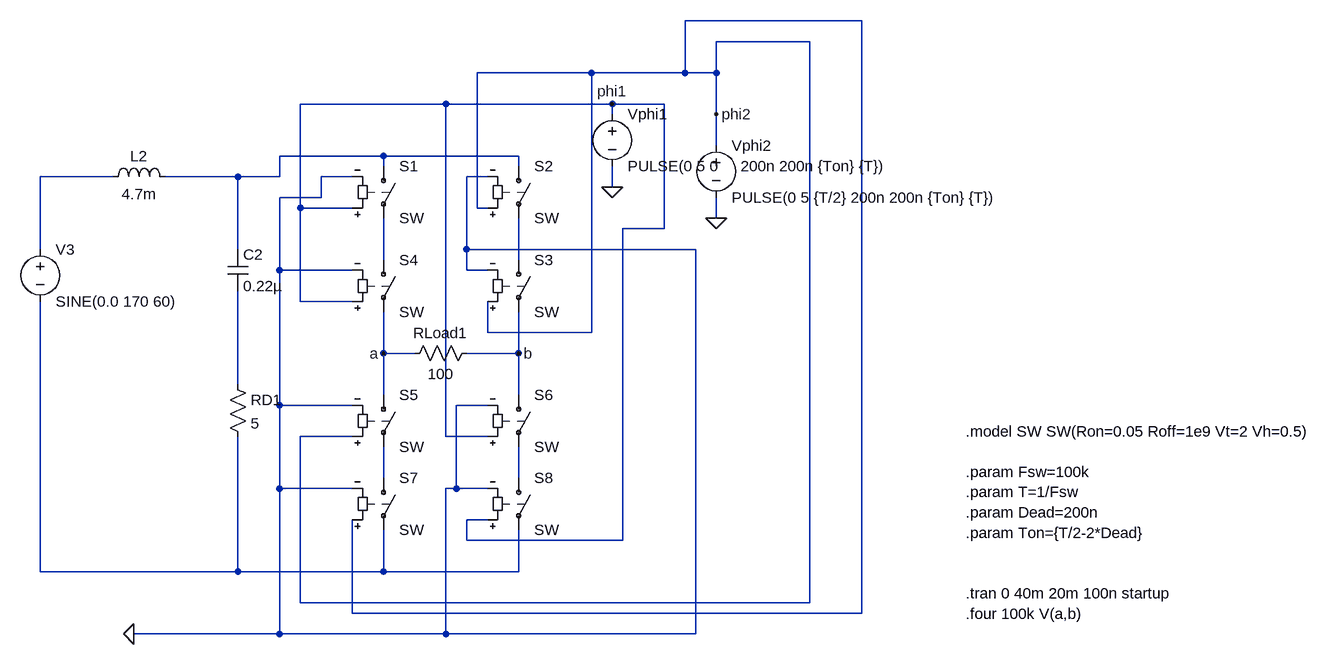
[diagram p0: schematic matrixconverter.asc]
matrixconverter.asc, the LTspice schematic file:
Version 4
SHEET 1 2016 1700
WIRE 1232 624 960 624
WIRE 1152 656 1008 656
WIRE 816 704 640 704
WIRE 960 704 960 624
WIRE 960 704 816 704
WIRE 1008 704 1008 656
WIRE 1008 704 960 704
WIRE 592 752 368 752
WIRE 848 752 592 752
WIRE 928 752 848 752
WIRE 848 768 848 752
WIRE 1008 768 1008 704
WIRE 1008 816 1008 768
WIRE 496 832 336 832
WIRE 704 832 496 832
WIRE 496 848 496 832
WIRE 704 848 704 832
WIRE 80 864 -32 864
WIRE 272 864 160 864
WIRE 336 864 336 832
WIRE 336 864 272 864
WIRE 448 864 400 864
WIRE 656 864 624 864
WIRE 848 880 848 848
WIRE 400 896 400 864
WIRE 400 896 336 896
WIRE 368 912 368 752
WIRE 448 912 368 912
WIRE 640 912 640 704
WIRE 656 912 640 912
WIRE 1008 928 1008 896
WIRE 928 944 928 752
WIRE 928 944 864 944
WIRE -32 976 -32 864
WIRE 272 976 272 864
WIRE 624 976 624 864
WIRE 976 976 624 976
WIRE 496 992 496 928
WIRE 704 992 704 928
WIRE 336 1008 336 896
WIRE 448 1008 336 1008
WIRE 624 1008 624 976
WIRE 656 1008 624 1008
WIRE 368 1056 368 912
WIRE 448 1056 368 1056
WIRE 656 1104 656 1056
WIRE 816 1104 816 704
WIRE 816 1104 656 1104
WIRE 496 1136 496 1072
WIRE 544 1136 496 1136
WIRE 704 1136 704 1072
WIRE 704 1136 624 1136
WIRE 272 1184 272 1040
WIRE 496 1200 496 1136
WIRE 704 1200 704 1136
WIRE 336 1216 336 1008
WIRE 448 1216 336 1216
WIRE 656 1216 608 1216
WIRE 448 1264 368 1264
WIRE 592 1264 592 752
WIRE 656 1264 592 1264
WIRE 496 1328 496 1280
WIRE 704 1328 704 1280
WIRE 336 1344 336 1216
WIRE 448 1344 336 1344
WIRE 608 1344 608 1216
WIRE 608 1344 592 1344
WIRE 656 1344 608 1344
WIRE 656 1392 624 1392
WIRE 624 1424 624 1392
WIRE 864 1424 864 944
WIRE 864 1424 624 1424
WIRE -32 1472 -32 1056
WIRE 272 1472 272 1264
WIRE 272 1472 -32 1472
WIRE 496 1472 496 1408
WIRE 496 1472 272 1472
WIRE 704 1472 704 1408
WIRE 704 1472 496 1472
WIRE 368 1520 368 1264
WIRE 1152 1520 1152 656
WIRE 1152 1520 368 1520
WIRE 448 1536 448 1392
WIRE 1232 1536 1232 624
WIRE 1232 1536 448 1536
WIRE 336 1568 336 1344
WIRE 336 1568 112 1568
WIRE 592 1568 592 1344
WIRE 592 1568 336 1568
WIRE 976 1568 976 976
WIRE 976 1568 592 1568
FLAG 496 1136 a
FLAG 704 1136 b
FLAG 848 752 phi1
FLAG 1008 768 phi2
FLAG 1008 928 0
FLAG 848 880 0
FLAG 112 1568 0
SYMBOL voltage -32 960 R0
WINDOW 123 0 0 Left 0
WINDOW 39 0 0 Left 0
SYMATTR InstName V3
SYMATTR Value SINE(0.0 170 60)
SYMBOL ind 64 880 R270
WINDOW 0 32 56 VTop 2
WINDOW 3 5 56 VBottom 2
SYMATTR InstName L2
SYMATTR Value 4.7m
SYMBOL cap 256 976 R0
SYMATTR InstName C2
SYMATTR Value 0.22µ
SYMBOL res 256 1168 R0
SYMATTR InstName RD1
SYMATTR Value 5
SYMBOL res 640 1120 R90
WINDOW 0 0 56 VBottom 2
WINDOW 3 32 56 VTop 2
SYMATTR InstName RLoad1
SYMATTR Value 100
SYMBOL sw 496 832 R0
SYMATTR InstName S1
SYMBOL sw 704 832 R0
SYMATTR InstName S2
SYMBOL sw 704 976 R0
SYMATTR InstName S3
SYMBOL sw 496 976 R0
SYMATTR InstName S4
SYMBOL sw 496 1184 R0
SYMATTR InstName S5
SYMBOL sw 704 1184 R0
SYMATTR InstName S6
SYMBOL sw 496 1312 R0
SYMATTR InstName S7
SYMBOL sw 704 1312 R0
SYMATTR InstName S8
SYMBOL voltage 1008 800 R0
WINDOW 123 0 0 Left 0
WINDOW 39 0 0 Left 0
SYMATTR InstName Vphi2
SYMATTR Value PULSE(0 5 {T/2} 200n 200n {Ton} {T})
SYMBOL voltage 848 752 R0
SYMATTR InstName Vphi1
SYMATTR Value PULSE(0 5 0     200n 200n {Ton} {T})
TEXT 1392 1256 Left 2 !.model SW SW(Ron=0.05 Roff=1e9 Vt=2 Vh=0.5)\n \n.param Fsw=100k\n.param T=1/Fsw\n.param Dead=200n\n.param Ton={T/2-2*Dead}\n \n \n.tran 0 40m 20m 100n startup\n.four 100k V(a,b)

The netlist it stands for:
* matrixconverter.asc
V3 N002 N008 SINE(0.0 170 60)
L2 N002 N001 4.7m
C2 N001 N005 0.22µ
RD1 N005 N008 5
RLoad1 b a 100
S1 N001 N003 phi1 0 SW
S2 N001 N004 phi2 0 SW
S3 N004 b phi2 0 SW
S4 N003 a phi1 0 SW
S5 a N006 phi2 0 SW
S6 b N007 phi1 0 SW
S7 N006 N008 phi2 0 SW
S8 N007 N008 phi1 0 SW
Vphi2 phi2 0 PULSE(0 5 {T/2} 200n 200n {Ton} {T})
Vphi1 phi1 0 PULSE(0 5 0     200n 200n {Ton} {T})
.model SW SW(Ron=0.05 Roff=1e9 Vt=2 Vh=0.5)
.param Fsw=100k
.param T=1/Fsw
.param Dead=200n
.param Ton={T/2-2*Dead}
.tran 0 40m 20m 100n startup
.four 100k V(a,b)
.backanno
.end